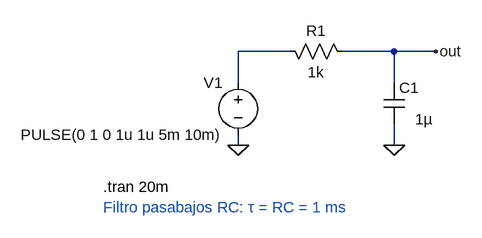
[diagram p0: schematic RC Filter.asc]
RC Filter.asc, the LTspice schematic file:
Version 4
SHEET 1 880 680
WIRE 0 16 0 -32
WIRE 0 -32 80 -32
WIRE 160 -32 240 -32
WIRE 240 -32 304 -32
WIRE 0 96 0 112
WIRE 240 -32 240 16
WIRE 240 112 240 80
FLAG 304 -32 out
FLAG 0 112 0
FLAG 240 112 0
SYMBOL voltage 0 0 M0
WINDOW 0 24 16 Left 2
WINDOW 3 24 96 Left 2
SYMATTR InstName V1
SYMATTR Value PULSE(0 1 0 1u 1u 5m 10m)
SYMATTR Prefix V
SYMBOL res 64 -48 M90
WINDOW 0 0 56 VBottom 2
WINDOW 3 32 56 VTop 2
SYMATTR InstName R1
SYMATTR Value 1k
SYMATTR Prefix R
SYMBOL cap 224 16 R0
WINDOW 0 24 8 Left 2
WINDOW 3 48 56 Left 2
SYMATTR InstName C1
SYMATTR Value 1µ
SYMATTR Prefix C
TEXT -208 176 Left 2 !.tran 20m
TEXT -208 208 Left 2 ;Filtro pasabajos RC: τ = RC = 1 ms

The netlist it stands for:
* RC Filter.asc
V1 N001 0 PULSE(0 1 0 1u 1u 5m 10m)
R1 N001 out 1k
C1 out 0 1µ
.tran 20m
* Filtro pasabajos RC: τ = RC = 1 ms
.backanno
.end